# Altium schematic sheet MCU-Sheet.SchDoc (part 1 of 3)
size 420 x 297 mm; SheetNumber: 2; SheetTotal: 3
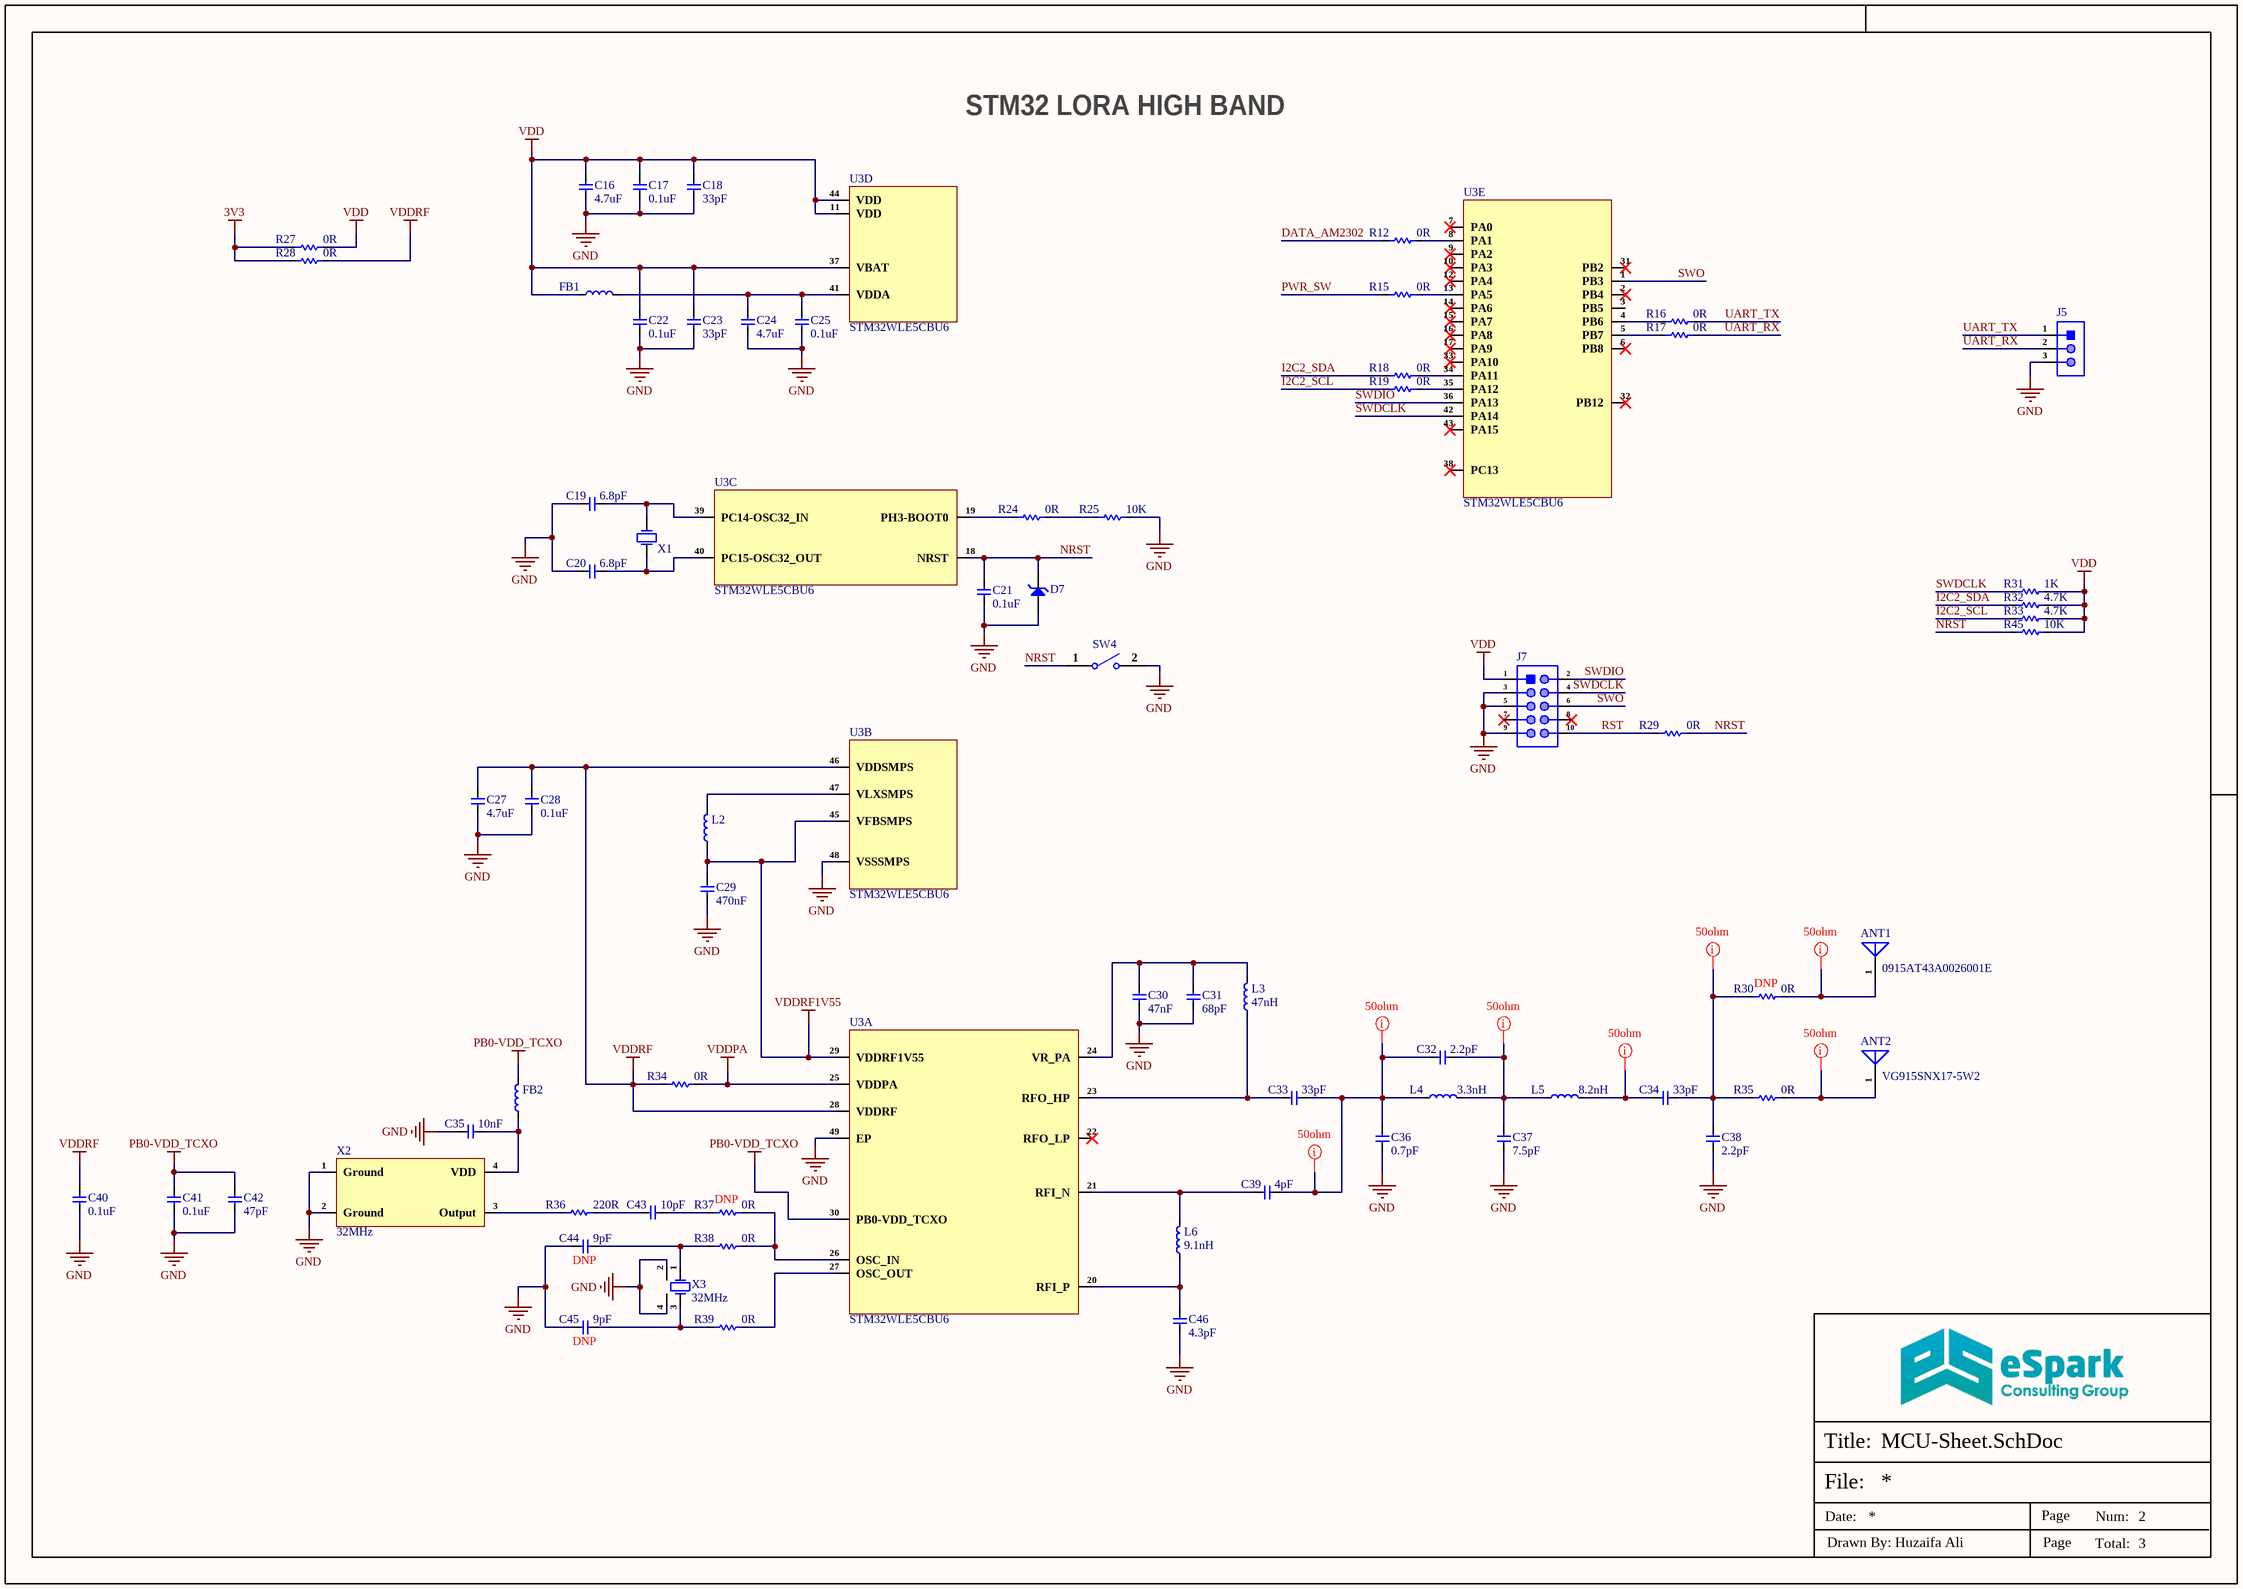
[diagram p0: MCU-Sheet.SchDoc]

## Parts
ANT1  0915AT43A0026001E  [0915AT43A0026001E]
ANT2  VG915SNX17-5W2  [VG915SNX17-5W2]
C16  4.7uF  [Cap-0402]
C17  0.1uF  [Cap-0402]
C18  33pF  [Cap-0402]
C19  6.8pF  [Cap-0402]
C20  6.8pF  [Cap-0402]
C21  0.1uF  [Cap-0402]
C22  0.1uF  [Cap-0402]
C23  33pF  [Cap-0402]
C24  4.7uF  [Cap-0402]
C25  0.1uF  [Cap-0402]
C27  4.7uF  [Cap-0402]
C28  0.1uF  [Cap-0402]
C29  470nF  [Cap-0402]
C30  47nF  [Cap-0402]
C31  68pF  [Cap-0402]
C32  2.2pF  [Cap-0402]
C33  33pF  [Cap-0402]
C34  33pF  [Cap-0402]
C35  10nF  [Cap-0402]
C36  0.7pF  [IND-0402]
C37  7.5pF  [Cap-0402]
C38  2.2pF  [Cap-0402]
C39  4pF  [Cap-0402]
C40  0.1uF  [Cap-0402]
C41  0.1uF  [Cap-0402]
C42  47pF  [Cap-0402]
C43  10pF  [Cap-0402]
C44  9pF  [Cap-0402]  (no BOM)
C45  9pF  [Cap-0402]  (no BOM)
C46  4.3pF  [Cap-0402]
D7  ESDALC6V1-1U2  [Diode-0201]  (value not drawn)
FB1  FCM1608KF-601T03  [IND-0603 (1608 Metric)]  (value not drawn)
FB2  BLM15HG102SN1D  [IND-0402]  (value not drawn)
J5  X6511WV-03H-C60D30  [HDR1X3_]  (value not drawn)
J7  X1321WVS-2x05J-C40D53  [X1321WVS-2x05J-C40D53]  (value not drawn)
L2  15uH  [IND-0805]  (value not drawn)
L3  47nH  [IND-0402]
L4  3.3nH  [IND-0402]
L5  8.2nH  [IND-0402]
L6  9.1nH  [IND-0402]
R12  0R  [Res-0402]  (no BOM)
R15  0R  [Res-0402]  (no BOM)
R16  0R  [Res-0402]
R17  0R  [Res-0402]
R18  0R  [Res-0402]  (no BOM)
R19  0R  [Res-0402]  (no BOM)
R24  0R  [Res-0402]
R25  10K  [Res-0402]
R27  0R  [Res-0805]
R28  0R  [Res-0805]
R29  0R  [Res-0402]
R30  0R  [Res-0402]  (no BOM)
R31  1K  [Res-0201]
R32  4.7K  [Res-0402]
R33  4.7K  [Res-0402]
R34  0R  [Res-0402]
R35  0R  [Res-0402]
R36  220R  [Res-0402]
R37  0R  [Res-0402]  (no BOM)
R38  0R  [Res-0402]
R39  0R  [Res-0402]
R45  10K  [Res-0402]  (no BOM)
SW4  B3U-1000P  [B3U-1000P]  (value not drawn)
U3  STM32WLE5CBU6  [48-UFQFPN(7x7)]  (parts A,B,C,D,E of 5)
X1  32.7680KHZ  [NX3215SA-32.768K-STD-MUA-8_]  (value not drawn)
X2  32MHz  [SMD2520-4P]
X3  32MHz  [SMD2520-4P]

## Nets
3V3: R27.1 R28.1
GND: C16.1 C17.1 C18.1 C19.1 C20.1 C21.1 C22.1 C23.1 C24.1 C25.1 C27.1 C28.1 C29.1 C30.1 C31.1 C35.1 C36.1 C37.1 C38.1 C40.1 C41.1 C42.1 C44.1 C45.1 C46.1 D7.2(A) J5.3 J7.3 J7.5 J7.9 R25.2 SW4.2 U3.48(VSSSMPS) U3.49(EP) X2.1(Ground) X2.2(Ground) X3.2(GND) X3.4(GND)
PB0-VDD_TCXO: C41.2 C42.2 FB2.2 U3.30(PB0-VDD_TCXO)
VDD: C16.2 C17.2 C18.2 C22.2 C23.2 FB1.1 J7.1 R27.2 R31.2 R32.2 R33.2 R45.2 U3.11(VDD) U3.37(VBAT) U3.44(VDD)
VDDPA: R34.2 U3.25(VDDPA)
VDDRF: C27.2 C28.2 C40.2 R28.2 R34.1 U3.28(VDDRF) U3.46(VDDSMPS)
VDDRF1V55: C29.2 L2.1 U3.29(VDDRF1V55) U3.45(VFBSMPS)
DATA_AM2302: R12.1
I2C2_SCL: R19.1 R33.1
I2C2_SDA: R18.1 R32.1
NRST: C21.2 D7.1(K) R29.2 R45.1 SW4.1 U3.18(NRST)
PWR_SW: R15.1
RST: J7.10 R29.1
SWDCLK: J7.4 R31.1 U3.42(PA14)
SWDIO: J7.2 U3.36(PA13)
SWO: J7.6 U3.1(PB3)
UART_RX: J5.2 R17.2
UART_TX: J5.1 R16.2
NetANT1_1: ANT1.1(FEED) R30.2
NetANT2_1: ANT2.1(FEED) R35.2
NetC19_2: C19.2 U3.39(PC14-OSC32_IN) X1.2(OSC2)
NetC20_2: C20.2 U3.40(PC15-OSC32_OUT) X1.1(OSC1)
NetC24_2: C24.2 C25.2 FB1.2 U3.41(VDDA)
NetC30_2: C30.2 C31.2 L3.2 U3.24(VR_PA)
NetC32_1: C32.1 C33.2 C36.2 C39.2 L4.1
NetC32_2: C32.2 C37.2 L4.2 L5.1
NetC33_1: C33.1 L3.1 U3.23(RFO_HP)
NetC34_1: C34.1 L5.2
NetC34_2: C34.2 C38.2 R30.1 R35.1
NetC35_2: C35.2 FB2.1 X2.4(VDD)
NetC39_1: C39.1 L6.2 U3.21(RFI_N)
NetC43_1: C43.1 R36.2
NetC43_2: C43.2 R37.1
NetC44_2: C44.2 R38.1 X3.1(IN/OUT)
NetC45_2: C45.2 R39.1 X3.3(Out/In)
NetC46_2: C46.2 L6.1 U3.20(RFI_P)
NetL2_2: L2.2 U3.47(VLXSMPS)
NetR12_2: R12.2 U3.8(PA1)
NetR15_2: R15.2 U3.13(PA5)
NetR16_1: R16.1 U3.4(PB6)
NetR17_1: R17.1 U3.5(PB7)
NetR18_2: R18.2 U3.34(PA11)
NetR19_2: R19.2 U3.35(PA12)
NetR24_1: R24.1 U3.19(PH3-BOOT0)
NetR24_2: R24.2 R25.1
NetR36_1: R36.1 X2.3(Output)
NetR37_2: R37.2 R38.2 U3.26(OSC_IN)
NetR39_2: R39.2 U3.27(OSC_OUT)

Not connected (* = marked no-connect by the designer): J7 7* 8*; U3 2(PB4)* 3(PB5) 6(PB8)* 7(PA0)* 9(PA2)* 10(PA3)* 12(PA4)* 14(PA6)* 15(PA7)* 16(PA8)* 17(PA9)* 22(RFO_LP)* 31(PB2)* 32(PB12)* 33(PA10)* 38(PC13)* 43(PA15)*

## Layout directives
mark named 50ohm: NetANT1_1, NetANT2_1, NetC32_1, NetC32_2, NetC34_1, NetC34_2

## Notes on the sheet
- STM32 LORA HIGH BAND
- (near R30) DNP
- (near R37) DNP
- (near C44) DNP
- (near C45) DNP
- File:
- Title:
- Date:
- Page
- Num:
- Total:
- Drawn By: Huzaifa Ali